# Altium project BopIt.PrjPcb
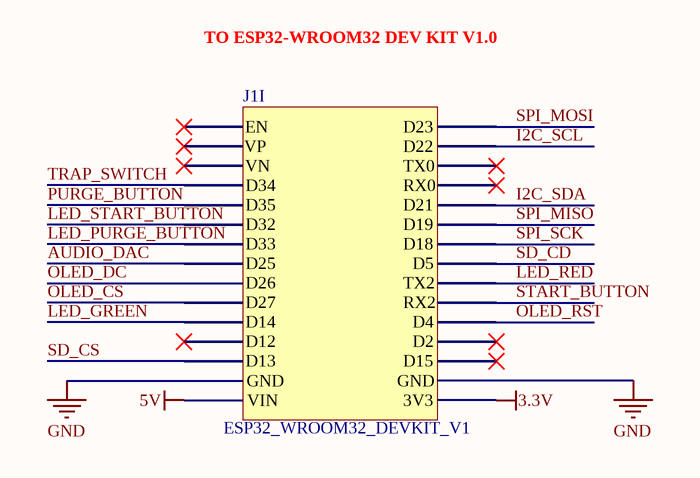
[diagram p0: DevKitESP32.SchDoc]
6 sheets, 34 parts. Net scope: global (net labels, ports and power ports of the same name join across sheets).
Board file: BopIt.PcbDoc
Sheets:
  DevKitESP32.SchDoc
  Power.SchDoc
  Input.SchDoc
  Display.SchDoc
  MicroSDAdapter.SchDoc
  AudioAmplifier.SchDoc

## Sheet DevKitESP32.SchDoc
size A; SheetNumber: 1; SheetTotal: 6

### Parts
J1  J1  [ESP32-DEVKIT-V1-FOOTPRINT]  (value not drawn)  (part I of 10)

### Nets
3.3V: J1.16(3V3)
5V: J1.15(VIN)
GND: J1.14(GND) J1.17(GND)
AUDIO_DAC: J1.8(D25)
I2C_SCL: J1.29(D22)
I2C_SDA: J1.26(D21)
LED_GREEN: J1.11(D14)
LED_PURGE_BUTTON: J1.7(D33)
LED_RED: J1.22(TX2)
LED_START_BUTTON: J1.6(D32)
OLED_CS: J1.10(D27)
OLED_DC: J1.9(D26)
OLED_RST: J1.20(D4)
PURGE_BUTTON: J1.5(D35)
SD_CD: J1.23(D5)
SD_CS: J1.13(D13)
SPI_MISO: J1.25(D19)
SPI_MOSI: J1.30(D23)
SPI_SCK: J1.24(D18)
START_BUTTON: J1.21(RX2)
TRAP_SWITCH: J1.4(D34)

Not connected (* = marked no-connect by the designer): J1 1(EN)* 2(VP)* 3(VN)* 12(D12)* 18(D15)* 19(D2)* 27(RX0)* 28(TX0)*

### Notes on the sheet
- TO ESP32-WROOM32 DEV KIT V1.0
- (in symbol Component_1, part I) ESP32_WROOM32_DEVKIT_V1

### Library data of the parts
J1 = Component_1

## Sheet Power.SchDoc
size A; SheetNumber: 2; SheetTotal: 6
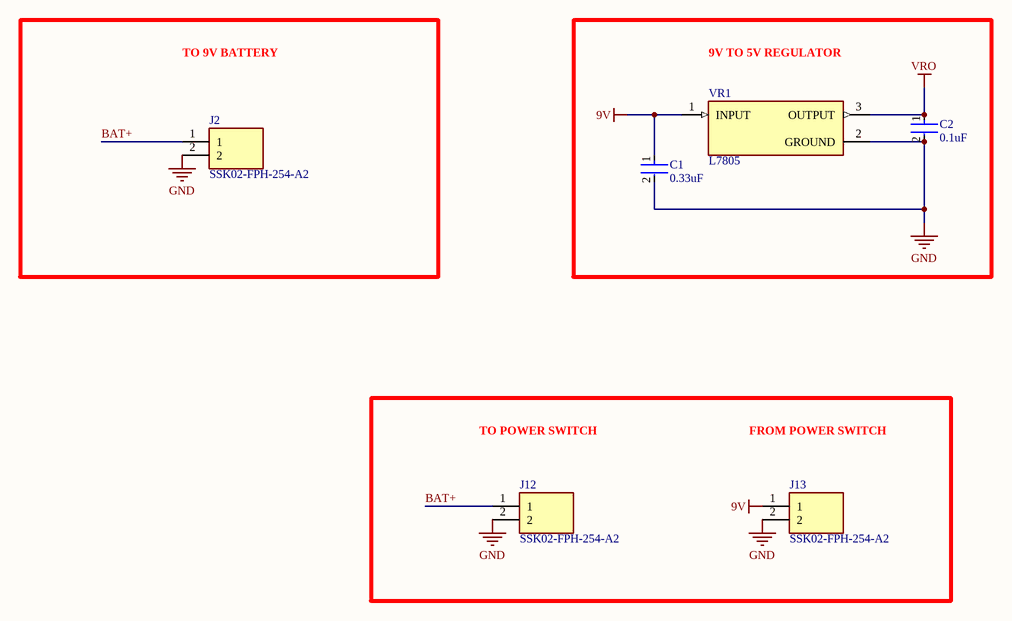
[diagram p1: Power.SchDoc]

### Parts
C1  0.33uF  [FP-RHE1DB-MFG]
C2  0.1uF  [FP-RHE1DB-MFG]
J2  SSK02-FPH-254-A2  [SAMESKY_SSK02-FPH-254-A2]
J12  SSK02-FPH-254-A2  [SAMESKY_SSK02-FPH-254-A2]
J13  SSK02-FPH-254-A2  [SAMESKY_SSK02-FPH-254-A2]
VR1  L7805  [TO255P1020X450X2000-3]

### Blocks framed on the sheet
TO 9V BATTERY: J2
9V TO 5V REGULATOR: C1 C2 VR1

### Nets
9V: C1.1 J13.1 VR1.1(INPUT)
GND: C1.2 C2.2 J2.2 J12.2 J13.2 VR1.2(GROUND)
VRO: C2.1 VR1.3(OUTPUT)
BAT+: J2.1 J12.1

### Notes on the sheet
- TO POWER SWITCH
- FROM POWER SWITCH

### Library data of the parts
C1 C2 = CMP-06035-012170-1: Ceramic Capacitor Automotive 330nF ±10% 50V X8L Radial; Tolerance: 10%; Lead Pitch: 2.5mm; Capacitance: 330nF; Max Operating Temperature: 150°C; Dielectric: X8L; Voltage Rating: 50V; Voltage Rating (DC): 50V; Min Operating Temperature: -55°C; REACH SVHC: No SVHC
J2 J12 J13 = SSK02-FPH-254-A2: 2 Position Header Connector 0.100 (2.54mm) Through Hole Gold; MF: Same Sky (Formerly CUI Devices); SnapEDA_Link: https://www.snapeda.com/parts/SSK02-FPH-254-A2/Same+Sky/view-part/?ref=snap; Package: None; Value: *; MP: SSK02-FPH-254-A2; Check_prices: https://www.snapeda.com/parts/SSK02-FPH-254-A2/Same+Sky/view-part/?ref=eda
VR1 = L7805: Standard Regulator Pos 5V 1.5A 3-Pin(3+Tab) TO-220FP Tube; MF: STMicroelectronics; MP: L7805; Value: *; SnapEDA_Link: https://www.snapeda.com/parts/L7805/STMicroelectronics/view-part/?ref=snap; Price: None; Package: None; Check_prices: https://www.snapeda.com/parts/L7805/STMicroelectronics/view-part/?ref=eda; Availability: Not in stock

## Sheet Input.SchDoc
size A; SheetNumber: 3; SheetTotal: 6
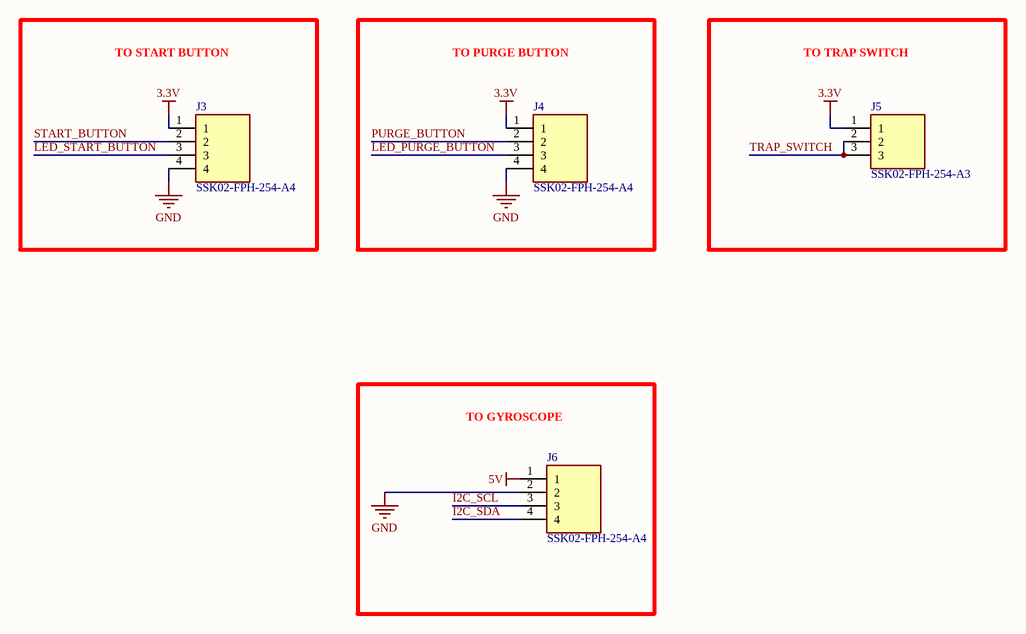
[diagram p2: Input.SchDoc]

### Parts
J3  SSK02-FPH-254-A4  [SAMESKY_SSK02-FPH-254-A4]
J4  SSK02-FPH-254-A4  [SAMESKY_SSK02-FPH-254-A4]
J5  SSK02-FPH-254-A3  [SAMESKY_SSK02-FPH-254-A3]
J6  SSK02-FPH-254-A4  [SAMESKY_SSK02-FPH-254-A4]

### Blocks framed on the sheet
TO START BUTTON: J3
TO PURGE BUTTON: J4
TO TRAP SWITCH: J5
TO GYROSCOPE: J6

### Nets
3.3V: J3.1 J4.1 J5.1
5V: J6.1
GND: J3.4 J4.4 J6.2
I2C_SCL: J6.3
I2C_SDA: J6.4
LED_PURGE_BUTTON: J4.3
LED_START_BUTTON: J3.3
PURGE_BUTTON: J4.2
START_BUTTON: J3.2
TRAP_SWITCH: J5.2 J5.3

### Library data of the parts
J3 J4 J6 = SSK02-FPH-254-A4: 4 Position Header Connector 0.100 (2.54mm) Through Hole Gold; MF: Same Sky (Formerly CUI Devices); SnapEDA_Link: https://www.snapeda.com/parts/SSK02-FPH-254-A4/Same+Sky/view-part/?ref=snap; Package: None; Value: *; MP: SSK02-FPH-254-A4; Check_prices: https://www.snapeda.com/parts/SSK02-FPH-254-A4/Same+Sky/view-part/?ref=eda
J5 = SSK02-FPH-254-A3: 2.54MM FEMALE HEADER 1X3PIN, Y T; MF: Same Sky (Formerly CUI Devices); SnapEDA_Link: https://www.snapeda.com/parts/SSK02-FPH-254-A3/Same+Sky/view-part/?ref=snap; Package: None; Value: *; MP: SSK02-FPH-254-A3; Check_prices: https://www.snapeda.com/parts/SSK02-FPH-254-A3/Same+Sky/view-part/?ref=eda

## Sheet Display.SchDoc
size A; SheetNumber: 4; SheetTotal: 6
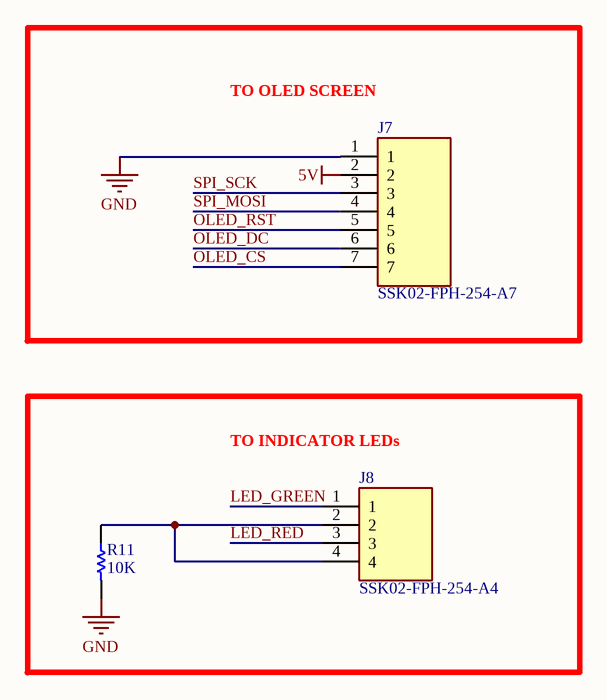
[diagram p3: Display.SchDoc]

### Parts
J7  SSK02-FPH-254-A7  [SAMESKY_SSK02-FPH-254-A7]
J8  SSK02-FPH-254-A4  [SAMESKY_SSK02-FPH-254-A4]
R11  10K  [RESA60-630X240]

### Blocks framed on the sheet
TO OLED SCREEN: J7
TO INDICATOR LEDs: J8 R11

### Nets
5V: J7.2
GND: J7.1 R11.2
LED_GREEN: J8.1
LED_RED: J8.3
OLED_CS: J7.7
OLED_DC: J7.6
OLED_RST: J7.5
SPI_MOSI: J7.4
SPI_SCK: J7.3
NetJ8_2: J8.2 J8.4 R11.1

### Library data of the parts
J7 = SSK02-FPH-254-A7: MF: {'manufacturer': u'Same Sky (Formerly CUI Devices)'}; Package: None; Price: None; Value: *; MP: SSK02-FPH-254-A7; Availability: Unavailable
J8 = SSK02-FPH-254-A4: as J3 on sheet Input; SnapEDA_Link: https://www.snapeda.com/parts/SSK02-FPH-254-A4/Same+Sky/view-part/?ref=snap; Package: None; Value: *; MP: SSK02-FPH-254-A4; Check_prices: https://www.snapeda.com/parts/SSK02-FPH-254-A4/Same+Sky/view-part/?ref=eda
R11 = CMP-1659-00070-1: Axial Resistor, 1 MOhm, +/- 1%, 250 mW, -55 to 155 degC, 2-Pin THD, RoHS, Bulk; Power Rating: 250 mW; Resistance: 47.5 kohm; Voltage Rating: 250 V; ComponentLink1Description: Manufacturer URL; PackageReference: MFR-25; ComponentLink2Description: Datasheet; ComponentLink2URL: http://www.yageo.com/documents/recent/Yageo%20LR_MFR_2013.pdf; Tolerance: 1%; DatasheetVersion: Apr-13; Package Quantity: 200; Packaging: Bulk; Case\Package: Axial; RoHSCompliant: true; ComponentLink1URL: http://www.yageo.com/; Length: 0.248 inch; Min Operating Temperature: -55 degC; Mount: Through Hole; PackageDescription: 2-Pin Axial Lead, Dia 2.4 mm, Body Length 6.3 mm; Max Operating Temperature: 155 degC

## Sheet MicroSDAdapter.SchDoc
size A; SheetNumber: 5; SheetTotal: 6
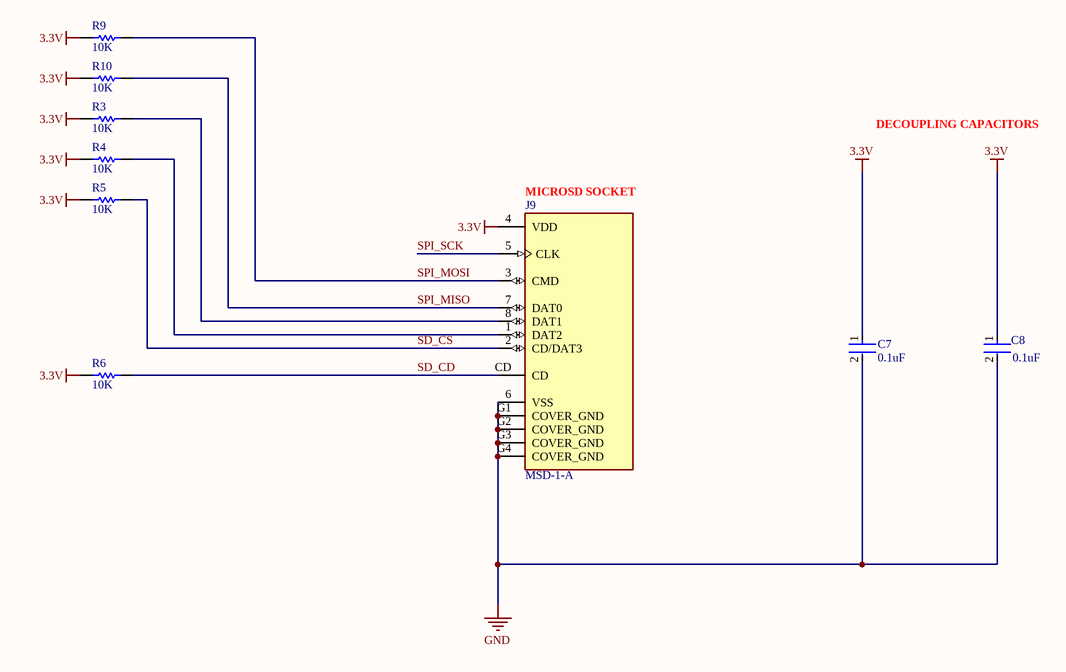
[diagram p4: MicroSDAdapter.SchDoc]

### Parts
C7  0.1uF  [FP-RHE1DB-MFG]
C8  0.1uF  [FP-RHE1DB-MFG]
J9  MSD-1-A  [CUI_MSD-1-A]
R3  10K  [RESA60-630X240]
R4  10K  [RESA60-630X240]
R5  10K  [RESA60-630X240]
R6  10K  [RESA60-630X240]
R9  10K  [RESA60-630X240]
R10  10K  [RESA60-630X240]

### Nets
3.3V: C7.1 C8.1 J9.4(VDD) R3.2 R4.2 R5.2 R6.2 R9.2 R10.2
GND: C7.2 C8.2 J9.6(VSS) J9.G1(COVER_GND) J9.G2(COVER_GND) J9.G3(COVER_GND) J9.G4(COVER_GND)
SD_CD: J9.CD R6.1
SD_CS: J9.2(CD/DAT3) R5.1
SPI_MISO: J9.7(DAT0) R10.1
SPI_MOSI: J9.3(CMD) R9.1
SPI_SCK: J9.5(CLK)
NetJ9_1: J9.1(DAT2) R4.1
NetJ9_8: J9.8(DAT1) R3.1

### Notes on the sheet
- DECOUPLING CAPACITORS
- (near J9) MICROSD SOCKET

### Library data of the parts
C7 C8 = CMP-06035-012170-1: as C1 on sheet Power; Tolerance: 10%; Lead Pitch: 2.5mm; Capacitance: 330nF; Max Operating Temperature: 150°C; Dielectric: X8L; Voltage Rating: 50V; Voltage Rating (DC): 50V; Min Operating Temperature: -55°C; REACH SVHC: No SVHC
J9 = MSD-1-A: Micro SD Card Connector, 9 Positions, Connector and Ejector, Push In, Auto Eject Out, Surface Mount, 1.8 mm Height Above Board, Gold Flash; MF: Same Sky; SnapEDA_Link: https://www.snapeda.com/parts/MSD-1-A/Same+Sky/view-part/?ref=snap; Package: None; Value: *; MP: MSD-1-A; Check_prices: https://www.snapeda.com/parts/MSD-1-A/Same+Sky/view-part/?ref=eda
R3-R6 R9 R10 = CMP-1659-00070-1: as R11 on sheet Display; ComponentLink1Description: Manufacturer URL; PackageReference: MFR-25; ComponentLink2Description: Datasheet; ComponentLink2URL: http://www.yageo.com/documents/recent/Yageo%20LR_MFR_2013.pdf; Tolerance: 1%; DatasheetVersion: Apr-13; Package Quantity: 200; Packaging: Bulk; Case\Package: Axial; RoHSCompliant: true; ComponentLink1URL: http://www.yageo.com/; Length: 0.248 inch; Min Operating Temperature: -55 degC; Mount: Through Hole; PackageDescription: 2-Pin Axial Lead, Dia 2.4 mm, Body Length 6.3 mm; Max Operating Temperature: 155 degC

## Sheet AudioAmplifier.SchDoc
size A; SheetNumber: 6; SheetTotal: 6
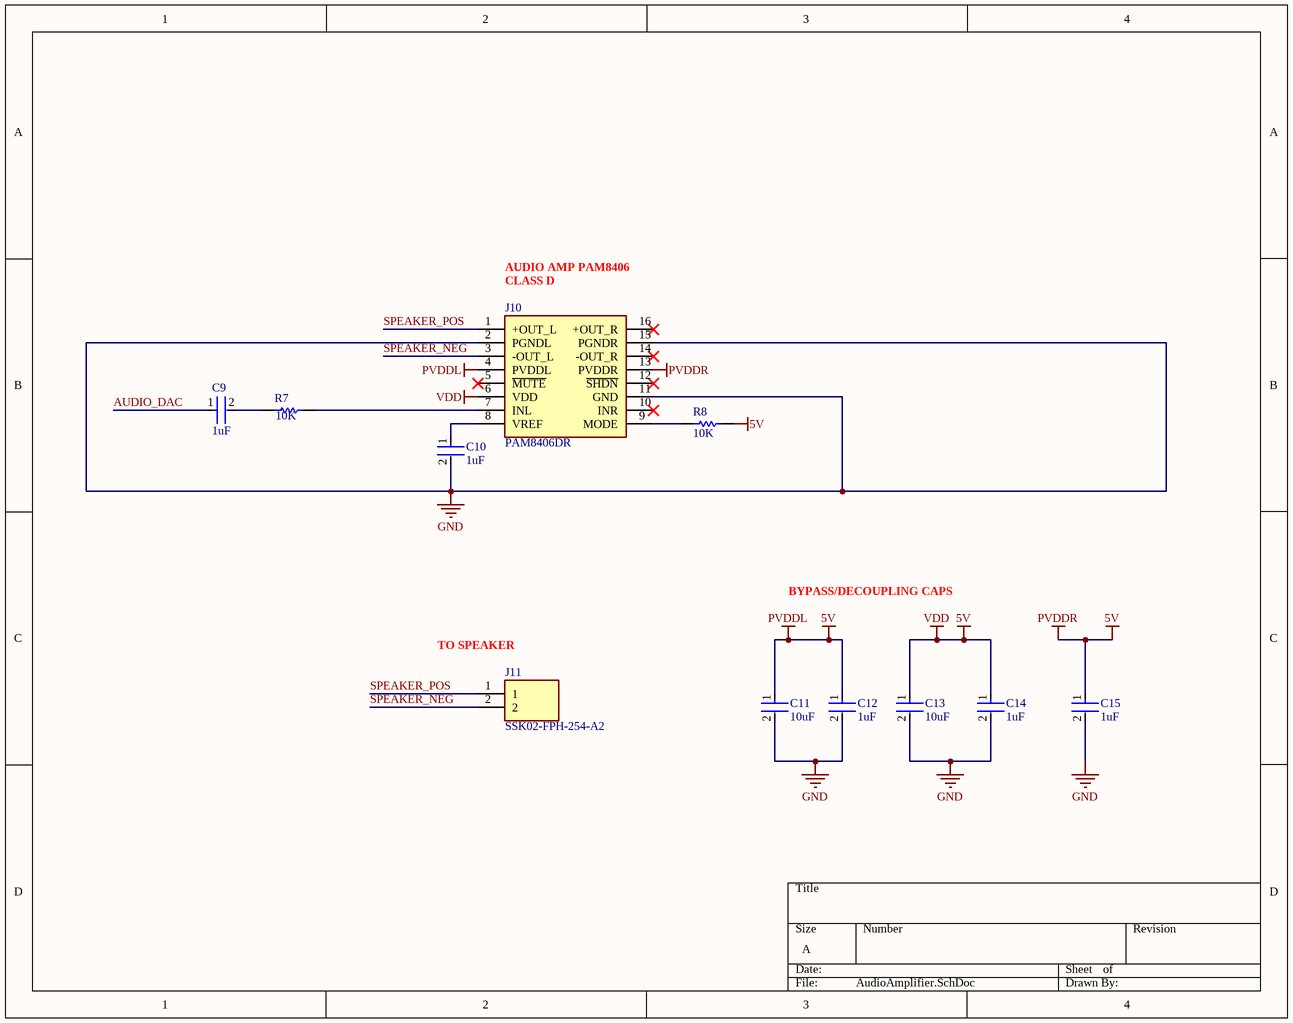
[diagram p5: AudioAmplifier.SchDoc]

### Parts
C9  1uF  [FP-RHE1DB-MFG]
C10  1uF  [FP-RHE1DB-MFG]
C11  10uF  [FP-RHE1DB-MFG]
C12  1uF  [FP-RHE1DB-MFG]
C13  10uF  [FP-RHE1DB-MFG]
C14  1uF  [FP-RHE1DB-MFG]
C15  1uF  [FP-RHE1DB-MFG]
J10  PAM8406DR  [SOIC127P600X126-16N]
J11  SSK02-FPH-254-A2  [SAMESKY_SSK02-FPH-254-A2]
R7  10K  [RESA60-630X240]
R8  10K  [RESA60-630X240]

### Nets
5V: C11.1 C12.1 C13.1 C14.1 C15.1 J10.4(PVDDL) J10.6(VDD) J10.13(PVDDR) R8.1  [also labelled PVDDL, PVDDR, VDD]
GND: C10.2 C11.2 C12.2 C13.2 C14.2 C15.2 J10.2(PGNDL) J10.11(GND) J10.15(PGNDR)
AUDIO_DAC: C9.1
SPEAKER_NEG: J10.3(-OUT_L) J11.2
SPEAKER_POS: J10.1(+OUT_L) J11.1
NetC9_2: C9.2 R7.2
NetC10_1: C10.1 J10.8(VREF)
NetJ10_7: J10.7(INL) R7.1
NetJ10_9: J10.9(MODE) R8.2

Not connected (* = marked no-connect by the designer): J10 5(~{MUTE})* 10(INR)* 12(~{SHDN})* 14(-OUT_R)* 16(+OUT_R)*

### Notes on the sheet
- AUDIO AMP PAM8406
- (near J10) CLASS D
- BYPASS/DECOUPLING CAPS
- (near J11) TO SPEAKER

### Library data of the parts
C9-C15 = CMP-06035-012170-1: as C1 on sheet Power; Tolerance: 10%; Lead Pitch: 2.5mm; Capacitance: 330nF; Max Operating Temperature: 150°C; Dielectric: X8L; Voltage Rating: 50V; Voltage Rating (DC): 50V; Min Operating Temperature: -55°C; REACH SVHC: No SVHC
J10 = PAM8406DR: DiodesZetex PAM8406DR 2-Channel Audio Amplifier, Class-AB, Class-D Stereo, 16-Pin SOP; Manufacturer_Name: Diodes Incorporated; Geometry.Height: 1.26mm; Manufacturer_Part_Number: PAM8406DR; Mouser Part Number: 621-PAM8406DR; Mouser Price/Stock: https://www.mouser.co.uk/ProductDetail/Diodes-Incorporated/PAM8406DR?qs=%252BSlWJf1dfkLK5VNh%252Bez%2F0Q%3D%3D; Arrow Part Number: PAM8406DR; Arrow Price/Stock: https://www.arrow.com/en/products/pam8406dr/diodes-incorporated?utm_currency=USD&region=asia; Datasheet Link: https://www.diodes.com//assets/Datasheets/PAM8406.pdf
J11 = SSK02-FPH-254-A2: as J2 on sheet Power; SnapEDA_Link: https://www.snapeda.com/parts/SSK02-FPH-254-A2/Same+Sky/view-part/?ref=snap; Package: None; Value: *; MP: SSK02-FPH-254-A2; Check_prices: https://www.snapeda.com/parts/SSK02-FPH-254-A2/Same+Sky/view-part/?ref=eda
R7 R8 = CMP-1659-00070-1: as R11 on sheet Display; ComponentLink1Description: Manufacturer URL; PackageReference: MFR-25; ComponentLink2Description: Datasheet; ComponentLink2URL: http://www.yageo.com/documents/recent/Yageo%20LR_MFR_2013.pdf; Tolerance: 1%; DatasheetVersion: Apr-13; Package Quantity: 200; Packaging: Bulk; Case\Package: Axial; RoHSCompliant: true; ComponentLink1URL: http://www.yageo.com/; Length: 0.248 inch; Min Operating Temperature: -55 degC; Mount: Through Hole; PackageDescription: 2-Pin Axial Lead, Dia 2.4 mm, Body Length 6.3 mm; Max Operating Temperature: 155 degC

## Nets that join several sheets
3.3V: DevKitESP32 (J1.16), Input (J3.1 J4.1 J5.1), MicroSDAdapter (9 pins)
5V: DevKitESP32 (J1.15), Input (J6.1), Display (J7.2), AudioAmplifier (9 pins)
GND: DevKitESP32 (J1.14 J1.17), Power (6 pins), Input (J3.4 J4.4 J6.2), Display (J7.1 R11.2), MicroSDAdapter (7 pins), AudioAmplifier (9 pins)
AUDIO_DAC: DevKitESP32 (J1.8), AudioAmplifier (C9.1)
I2C_SCL: DevKitESP32 (J1.29), Input (J6.3)
I2C_SDA: DevKitESP32 (J1.26), Input (J6.4)
LED_GREEN: DevKitESP32 (J1.11), Display (J8.1)
LED_PURGE_BUTTON: DevKitESP32 (J1.7), Input (J4.3)
LED_RED: DevKitESP32 (J1.22), Display (J8.3)
LED_START_BUTTON: DevKitESP32 (J1.6), Input (J3.3)
OLED_CS: DevKitESP32 (J1.10), Display (J7.7)
OLED_DC: DevKitESP32 (J1.9), Display (J7.6)
OLED_RST: DevKitESP32 (J1.20), Display (J7.5)
PURGE_BUTTON: DevKitESP32 (J1.5), Input (J4.2)
SD_CD: DevKitESP32 (J1.23), MicroSDAdapter (J9.CD R6.1)
SD_CS: DevKitESP32 (J1.13), MicroSDAdapter (J9.2 R5.1)
SPI_MISO: DevKitESP32 (J1.25), MicroSDAdapter (J9.7 R10.1)
SPI_MOSI: DevKitESP32 (J1.30), Display (J7.4), MicroSDAdapter (J9.3 R9.1)
SPI_SCK: DevKitESP32 (J1.24), Display (J7.3), MicroSDAdapter (J9.5)
START_BUTTON: DevKitESP32 (J1.21), Input (J3.2)
TRAP_SWITCH: DevKitESP32 (J1.4), Input (J5.2 J5.3)